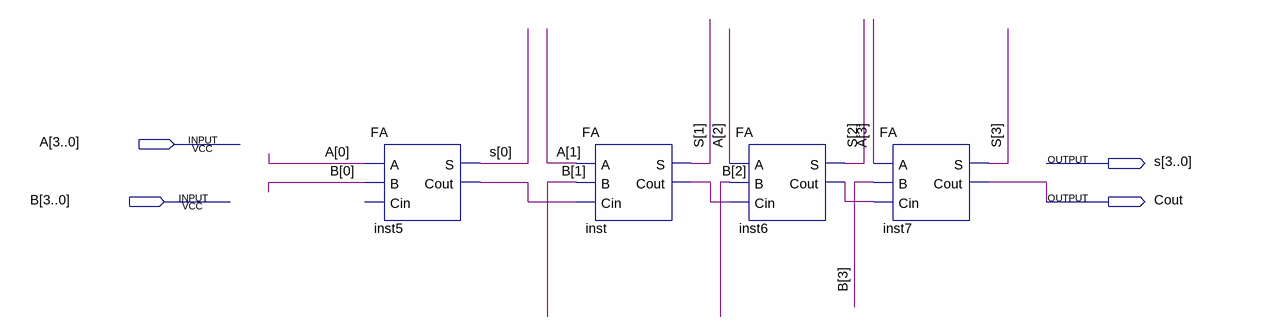
[diagram p0: schematic sheet]
// Quartus schematic RCA.bdf as structural Verilog: 4 symbols, 4 pins
module RCA (
  input  [3:0] A,
  input  [3:0] B,
  output [3:0] s,
  output Cout
);

  wire inst5_cout, inst6_cout, inst_cout;

  FA inst5 (.A(A[0]), .B(B[0]), .S(s[0]), .Cout(inst5_cout));  // open: Cin
  FA inst (.A(A[1]), .B(B[1]), .Cin(inst5_cout), .S(s[1]), .Cout(inst_cout));
  FA inst6 (.A(A[2]), .B(B[2]), .Cin(inst_cout), .S(s[2]), .Cout(inst6_cout));
  FA inst7 (.A(A[3]), .B(B[3]), .Cin(inst6_cout), .S(s[3]), .Cout(Cout));
endmodule
